# Altium schematic sheet 13_Wireless.SchDoc
size 812 x 508 mm; SheetNumber: 13; SheetTotal: 16
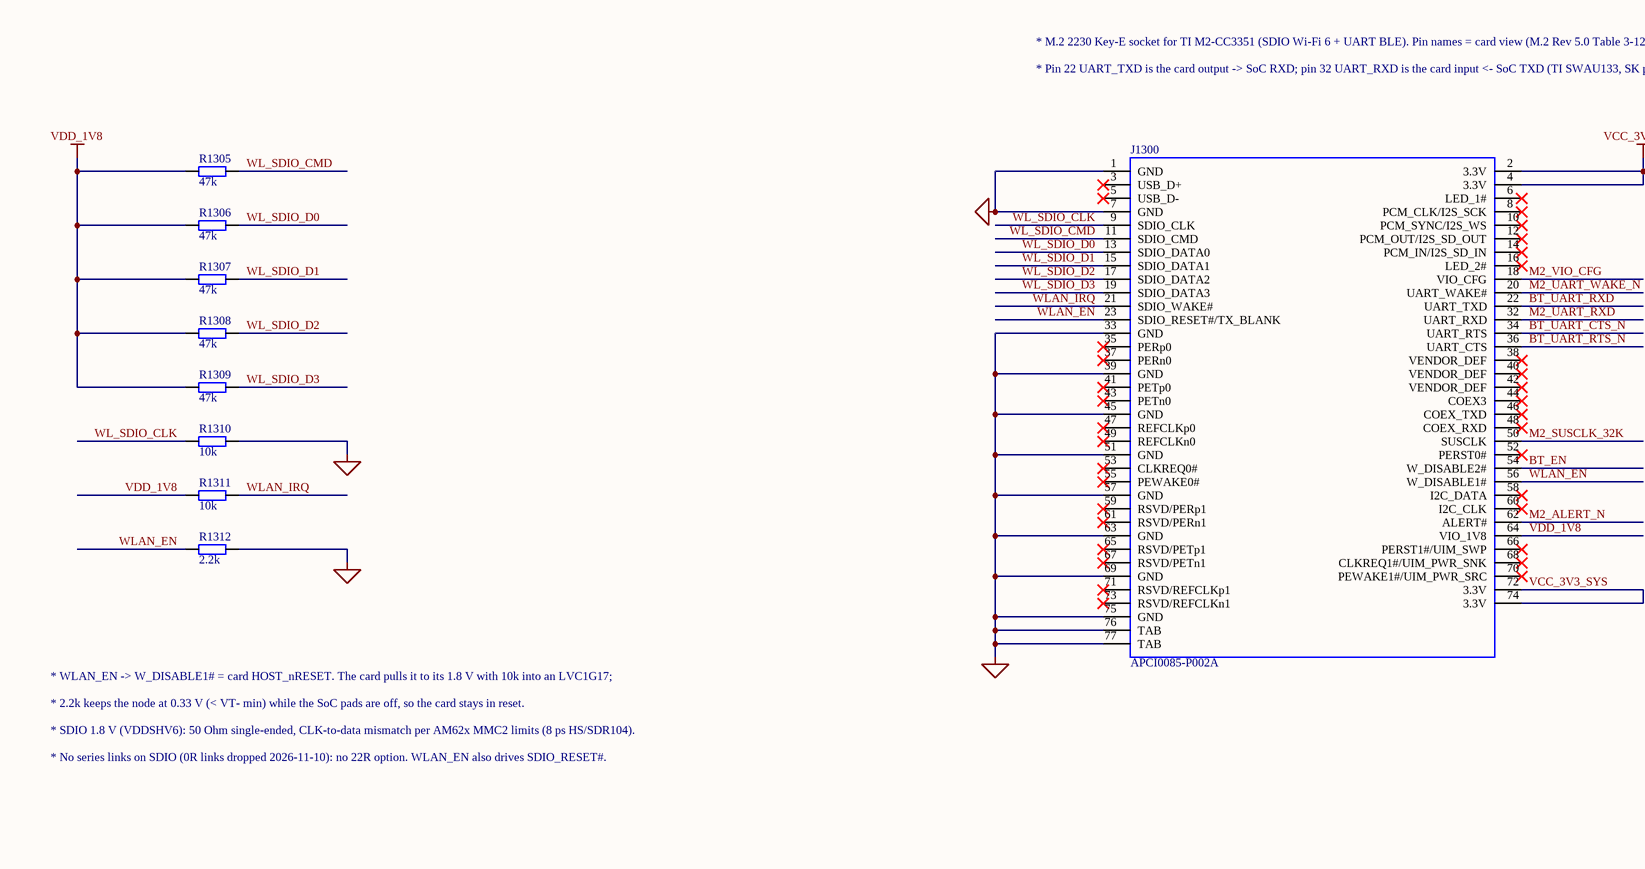
[diagram p0: 13_Wireless.SchDoc, left]
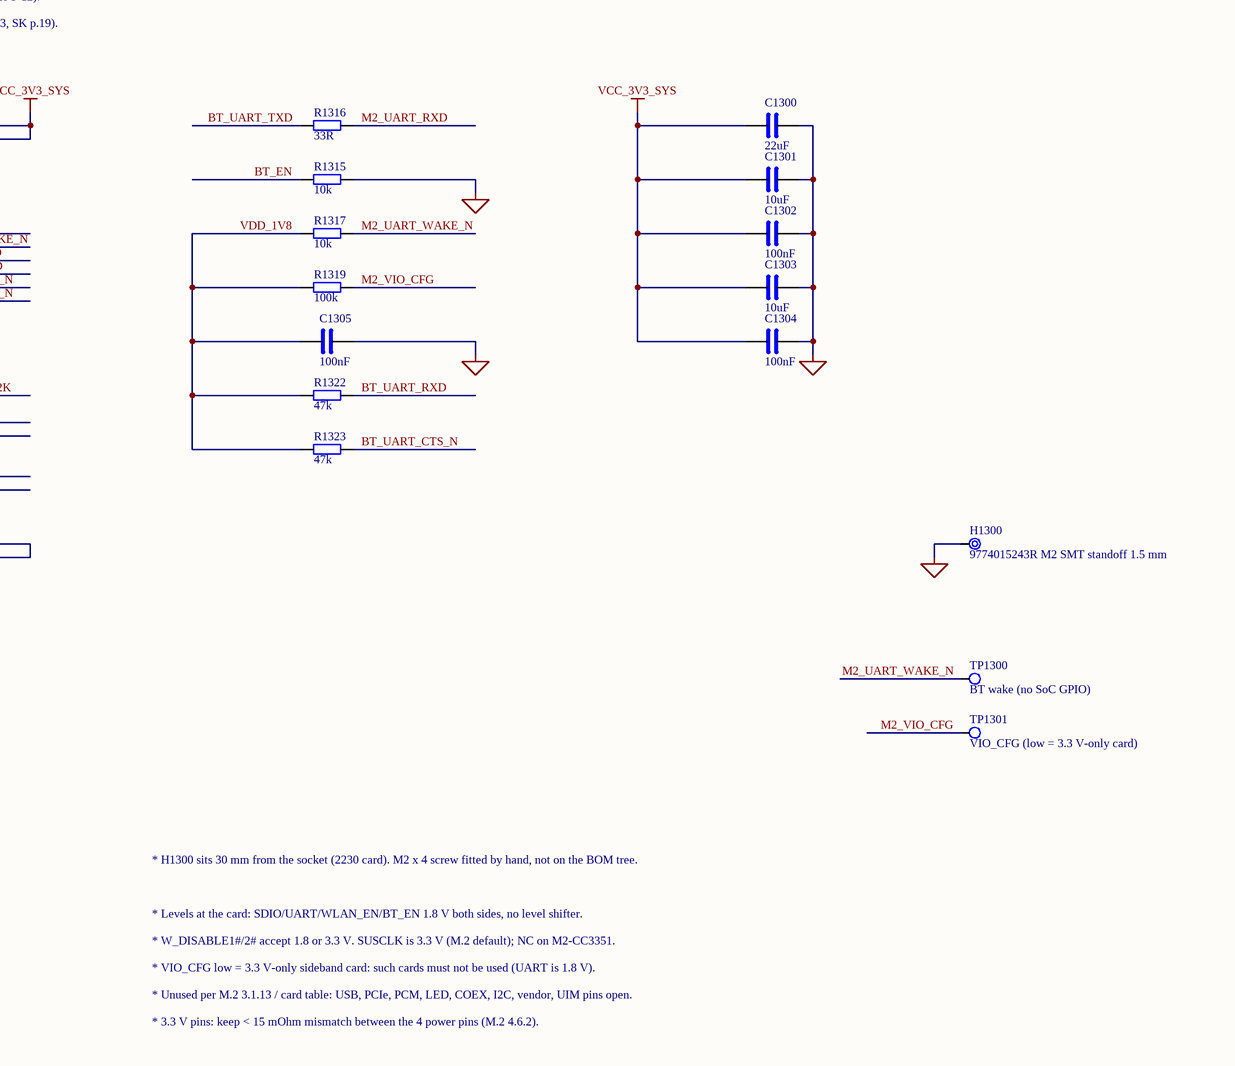
[diagram p1: 13_Wireless.SchDoc, right]

## Parts
C1300  22uF  [C0805]
C1301  10uF  [C0603]
C1302  100nF  [C0402]
C1303  10uF  [C0603]
C1304  100nF  [C0402]
C1305  100nF  [C0402]
H1300  9774015243R M2 SMT standoff 1.5 mm  [STANDOFF_WE_9774015243R]
J1300  APCI0085-P002A  [M2_KEYE_APCI0085]
R1305  47k  [R0402]
R1306  47k  [R0402]
R1307  47k  [R0402]
R1308  47k  [R0402]
R1309  47k  [R0402]
R1310  10k  [R0402]
R1311  10k  [R0402]
R1312  2.2k  [R0402]
R1315  10k  [R0402]
R1316  33R  [R0402]
R1317  10k  [R0402]
R1319  100k  [R0402]
R1322  47k  [R0402]
R1323  47k  [R0402]
TP1300  BT wake (no SoC GPIO)  [TP_PAD_1.0]
TP1301  VIO_CFG (low = 3.3 V-only card)  [TP_PAD_1.0]

## Nets
GND: C1300.2 C1301.2 C1302.2 C1303.2 C1304.2 C1305.2 H1300.1(MH) J1300.1(GND) J1300.7(GND) J1300.33(GND) J1300.39(GND) J1300.45(GND) J1300.51(GND) J1300.57(GND) J1300.63(GND) J1300.69(GND) J1300.75(GND) J1300.76(TAB) J1300.77(TAB) R1310.2 R1312.2 R1315.2
VCC_3V3_SYS: C1300.1 C1301.1 C1302.1 C1303.1 C1304.1 J1300.2(3.3V) J1300.4(3.3V) J1300.72(3.3V) J1300.74(3.3V)
VDD_1V8: C1305.1 J1300.64(VIO_1V8) R1305.1 R1306.1 R1307.1 R1308.1 R1309.1 R1311.1 R1317.1 R1319.1 R1322.1 R1323.1
BT_EN: J1300.54(W_DISABLE2#) R1315.1
BT_UART_CTS_N: J1300.34(UART_RTS) R1323.2
BT_UART_RTS_N: J1300.36(UART_CTS)
BT_UART_RXD: J1300.22(UART_TXD) R1322.2
BT_UART_TXD: R1316.1
M2_ALERT_N: J1300.62(ALERT#)
M2_SUSCLK_32K: J1300.50(SUSCLK)
M2_UART_RXD: J1300.32(UART_RXD) R1316.2
M2_UART_WAKE_N: J1300.20(UART_WAKE#) R1317.2 TP1300.1(TP)
M2_VIO_CFG: J1300.18(VIO_CFG) R1319.2 TP1301.1(TP)
WL_SDIO_CLK: J1300.9(SDIO_CLK) R1310.1
WL_SDIO_CMD: J1300.11(SDIO_CMD) R1305.2
WL_SDIO_D0: J1300.13(SDIO_DATA0) R1306.2
WL_SDIO_D1: J1300.15(SDIO_DATA1) R1307.2
WL_SDIO_D2: J1300.17(SDIO_DATA2) R1308.2
WL_SDIO_D3: J1300.19(SDIO_DATA3) R1309.2
WLAN_EN: J1300.23(SDIO_RESET#/TX_BLANK) J1300.56(W_DISABLE1#) R1312.1
WLAN_IRQ: J1300.21(SDIO_WAKE#) R1311.2

Not connected (* = marked no-connect by the designer): J1300 3(USB_D+)* 5(USB_D-)* 6(LED_1#)* 8(PCM_CLK/I2S_SCK)* 10(PCM_SYNC/I2S_WS)* 12(PCM_OUT/I2S_SD_OUT)* 14(PCM_IN/I2S_SD_IN)* 16(LED_2#)* 35(PERp0)* 37(PERn0)* 38(VENDOR_DEF)* 40(VENDOR_DEF)* 41(PETp0)* 42(VENDOR_DEF)* 43(PETn0)* 44(COEX3)* 46(COEX_TXD)* 47(REFCLKp0)* 48(COEX_RXD)* 49(REFCLKn0)* 52(PERST0#)* 53(CLKREQ0#)* 55(PEWAKE0#)* 58(I2C_DATA)* 59(RSVD/PERp1)* 60(I2C_CLK)* 61(RSVD/PERn1)* 65(RSVD/PETp1)* 66(PERST1#/UIM_SWP)* 67(RSVD/PETn1)* 68(CLKREQ1#/UIM_PWR_SNK)* 70(PEWAKE1#/UIM_PWR_SRC)* 71(RSVD/REFCLKp1)* 73(RSVD/REFCLKn1)*

## Notes on the sheet
- * M.2 2230 Key-E socket for TI M2-CC3351 (SDIO Wi-Fi 6 + UART BLE). Pin names = card view (M.2 Rev 5.0 Table 3-12).
- * Pin 22 UART_TXD is the card output -> SoC RXD; pin 32 UART_RXD is the card input <- SoC TXD (TI SWAU133, SK p.19).
- * WLAN_EN -> W_DISABLE1# = card HOST_nRESET. The card pulls it to its 1.8 V with 10k into an LVC1G17;
- * 2.2k keeps the node at 0.33 V (< VT- min) while the SoC pads are off, so the card stays in reset.
- * SDIO 1.8 V (VDDSHV6): 50 Ohm single-ended, CLK-to-data mismatch per AM62x MMC2 limits (8 ps HS/SDR104).
- * No series links on SDIO (0R links dropped 2026-11-10): no 22R option. WLAN_EN also drives SDIO_RESET#.
- * H1300 sits 30 mm from the socket (2230 card). M2 x 4 screw fitted by hand, not on the BOM tree.
- * Levels at the card: SDIO/UART/WLAN_EN/BT_EN 1.8 V both sides, no level shifter.
- * W_DISABLE1#/2# accept 1.8 or 3.3 V. SUSCLK is 3.3 V (M.2 default); NC on M2-CC3351.
- * VIO_CFG low = 3.3 V-only sideband card: such cards must not be used (UART is 1.8 V).
- * Unused per M.2 3.1.13 / card table: USB, PCIe, PCM, LED, COEX, I2C, vendor, UIM pins open.
- * 3.3 V pins: keep < 15 mOhm mismatch between the 4 power pins (M.2 4.6.2).

## Library data of the parts
C1300 = CAP: Capacitor, non-polarized; MPN: CL21A226MAQNNNE; Manufacturer: Samsung; Spec: 22uF 25V X5R 0805 (bulk); LCSC: C45783
C1301 = CAP: Capacitor, non-polarized; Spec: 10uF 10V X5R 0603 (pins 2/4)
C1302 = CAP: Capacitor, non-polarized; MPN: CL05B104KO5NNNC; Manufacturer: Samsung; Spec: 100nF 16V X7R 0402 (pins 2/4); LCSC: C1525
C1303 = CAP: Capacitor, non-polarized; Spec: 10uF 10V X5R 0603 (pins 72/74)
C1304 = CAP: Capacitor, non-polarized; MPN: CL05B104KO5NNNC; Manufacturer: Samsung; Spec: 100nF 16V X7R 0402 (pins 72/74); LCSC: C1525
C1305 = CAP: Capacitor, non-polarized; MPN: CL05B104KO5NNNC; Manufacturer: Samsung; Spec: 100nF 16V X7R 0402 (pin 64); LCSC: C1525
H1300 = MOUNTING_HOLE: Plated mounting hole (pin to GND); Manufacturer: Wurth Elektronik; MPN: 9774015243R; LCSC: C22431324
J1300 = APCI0085-P002A: M.2 Key-E socket, 67 contacts 0.5 mm, H3.2, 2 SMT tabs (LOTES APCI0085-P002A); MPN: APCI0085-P002A; Manufacturer: LOTES; LCSC: C841649
R1305-R1309 = RES: Resistor; MPN: 0402WGF4702TCE; Manufacturer: UNI-ROYAL; Spec: 47k 0402 (SDIO pull-up); LCSC: C25792
R1310 = RES: Resistor; MPN: 0402WGF1002TCE; Manufacturer: UNI-ROYAL; Spec: 10k 0402 (SK R12, clock low while pad is off); LCSC: C25744
R1311 = RES: Resistor; MPN: 0402WGF1002TCE; Manufacturer: UNI-ROYAL; Spec: 10k 0402 (card IRQ is open drain, SK R6); LCSC: C25744
R1312 = RES: Resistor; Spec: 2.2k 0402 (beats the card's 10k pull-up: 0.33 V)
R1315 = RES: Resistor; MPN: 0402WGF1002TCE; Manufacturer: UNI-ROYAL; Spec: 10k 0402 (W_DISABLE2#: BT off by default); LCSC: C25744
R1316 = RES: Resistor; Spec: 33R 0402 (SK R24)
R1317 = RES: Resistor; MPN: 0402WGF1002TCE; Manufacturer: UNI-ROYAL; Spec: 10k 0402 (card IRQ_BLE open drain); LCSC: C25744
R1319 = RES: Resistor; Spec: 100k 0402 (VIO_CFG weak pull-up, M.2 3.1.15)
R1322 = RES: Resistor; MPN: 0402WGF4702TCE; Manufacturer: UNI-ROYAL; Spec: 47k 0402 (UART6 RXD pull-up, 62_UART_2); LCSC: C25792
R1323 = RES: Resistor; MPN: 0402WGF4702TCE; Manufacturer: UNI-ROYAL; Spec: 47k 0402 (UART6 CTSn pull-up); LCSC: C25792
TP1300 TP1301 = TESTPOINT: Test point